# EasyEDA Pro project ProPrj_omb-2024-nano_2026-02-09.epro, schematic Schematic1_5

## Sheets
1 P1: Board Name: v5-artemis-ble; Create Date: 2025-02-28; Page Name: P1; Project Name: omb-2024-nano; Schematic Name: Schematic1_5; Update Date: 2025-03-06; Company: EasyEDA.com; Drawn: gauteh, rogers; Page Size: A4; Part Number: JLCPCB-002; Reviewed: EasyEDA; Version: V1.4
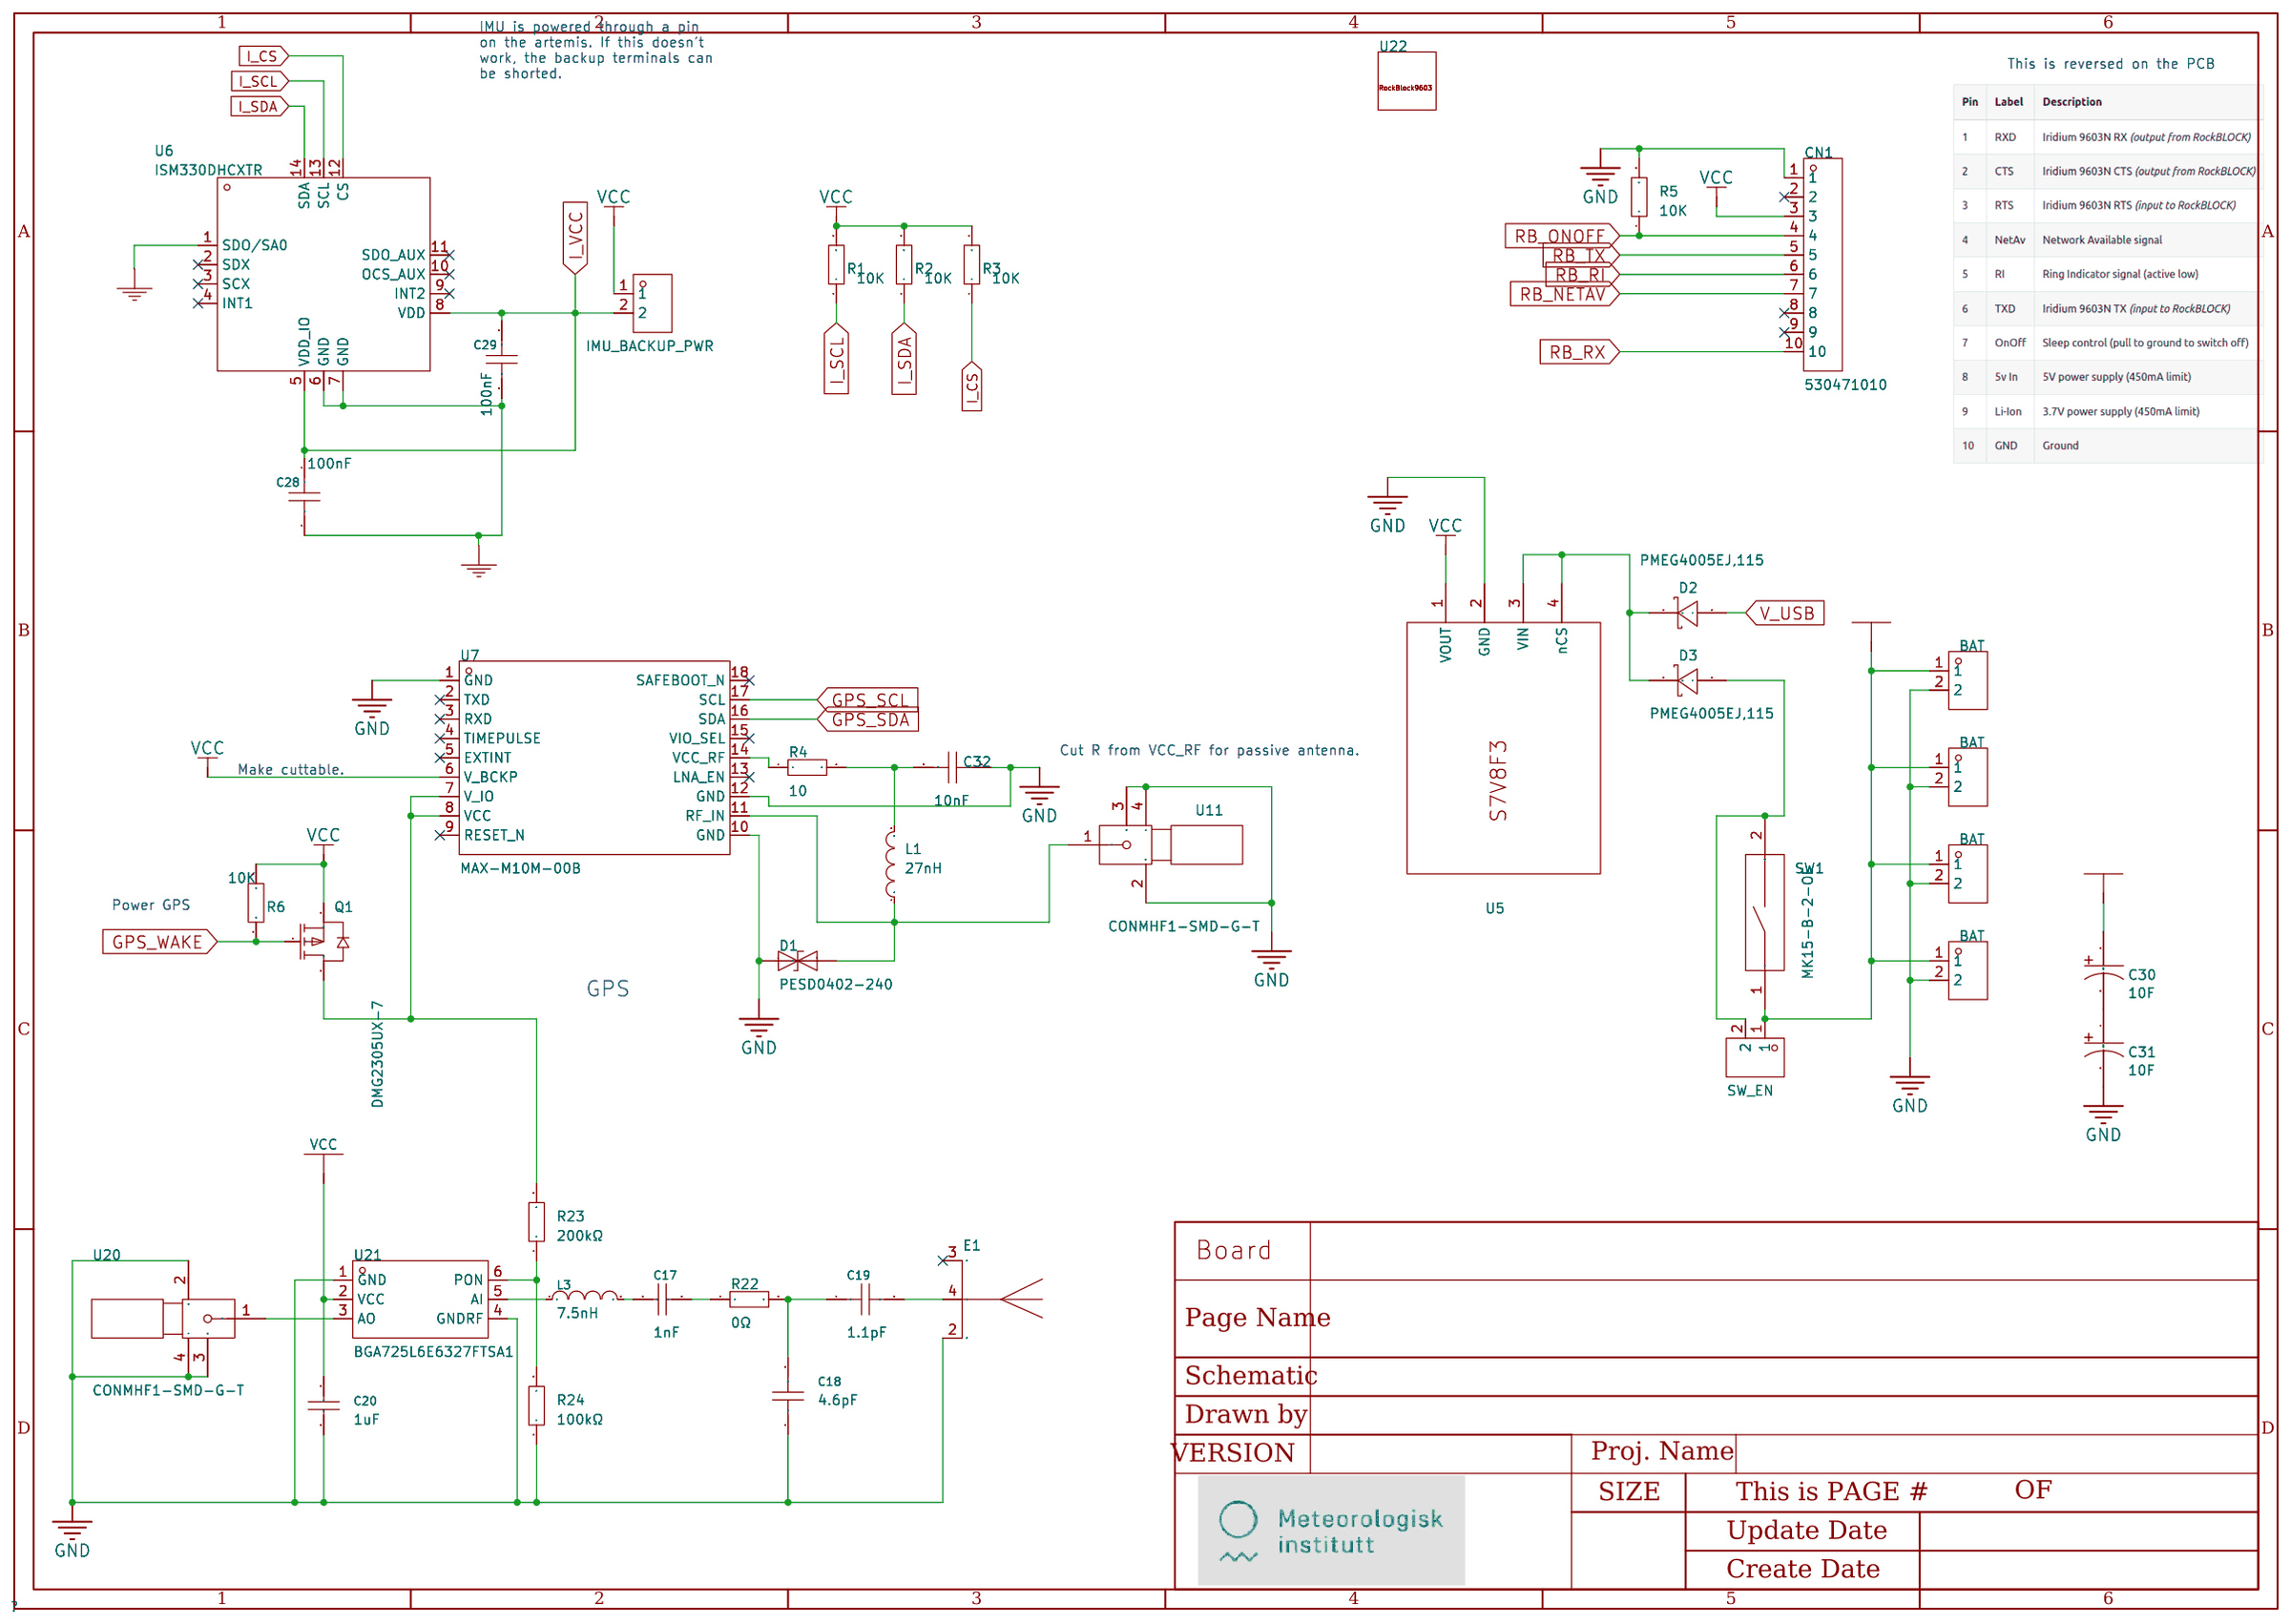
[diagram p5: P1]
2 P2: Page Name: P2; Drawn: rogers; Version: v1.4
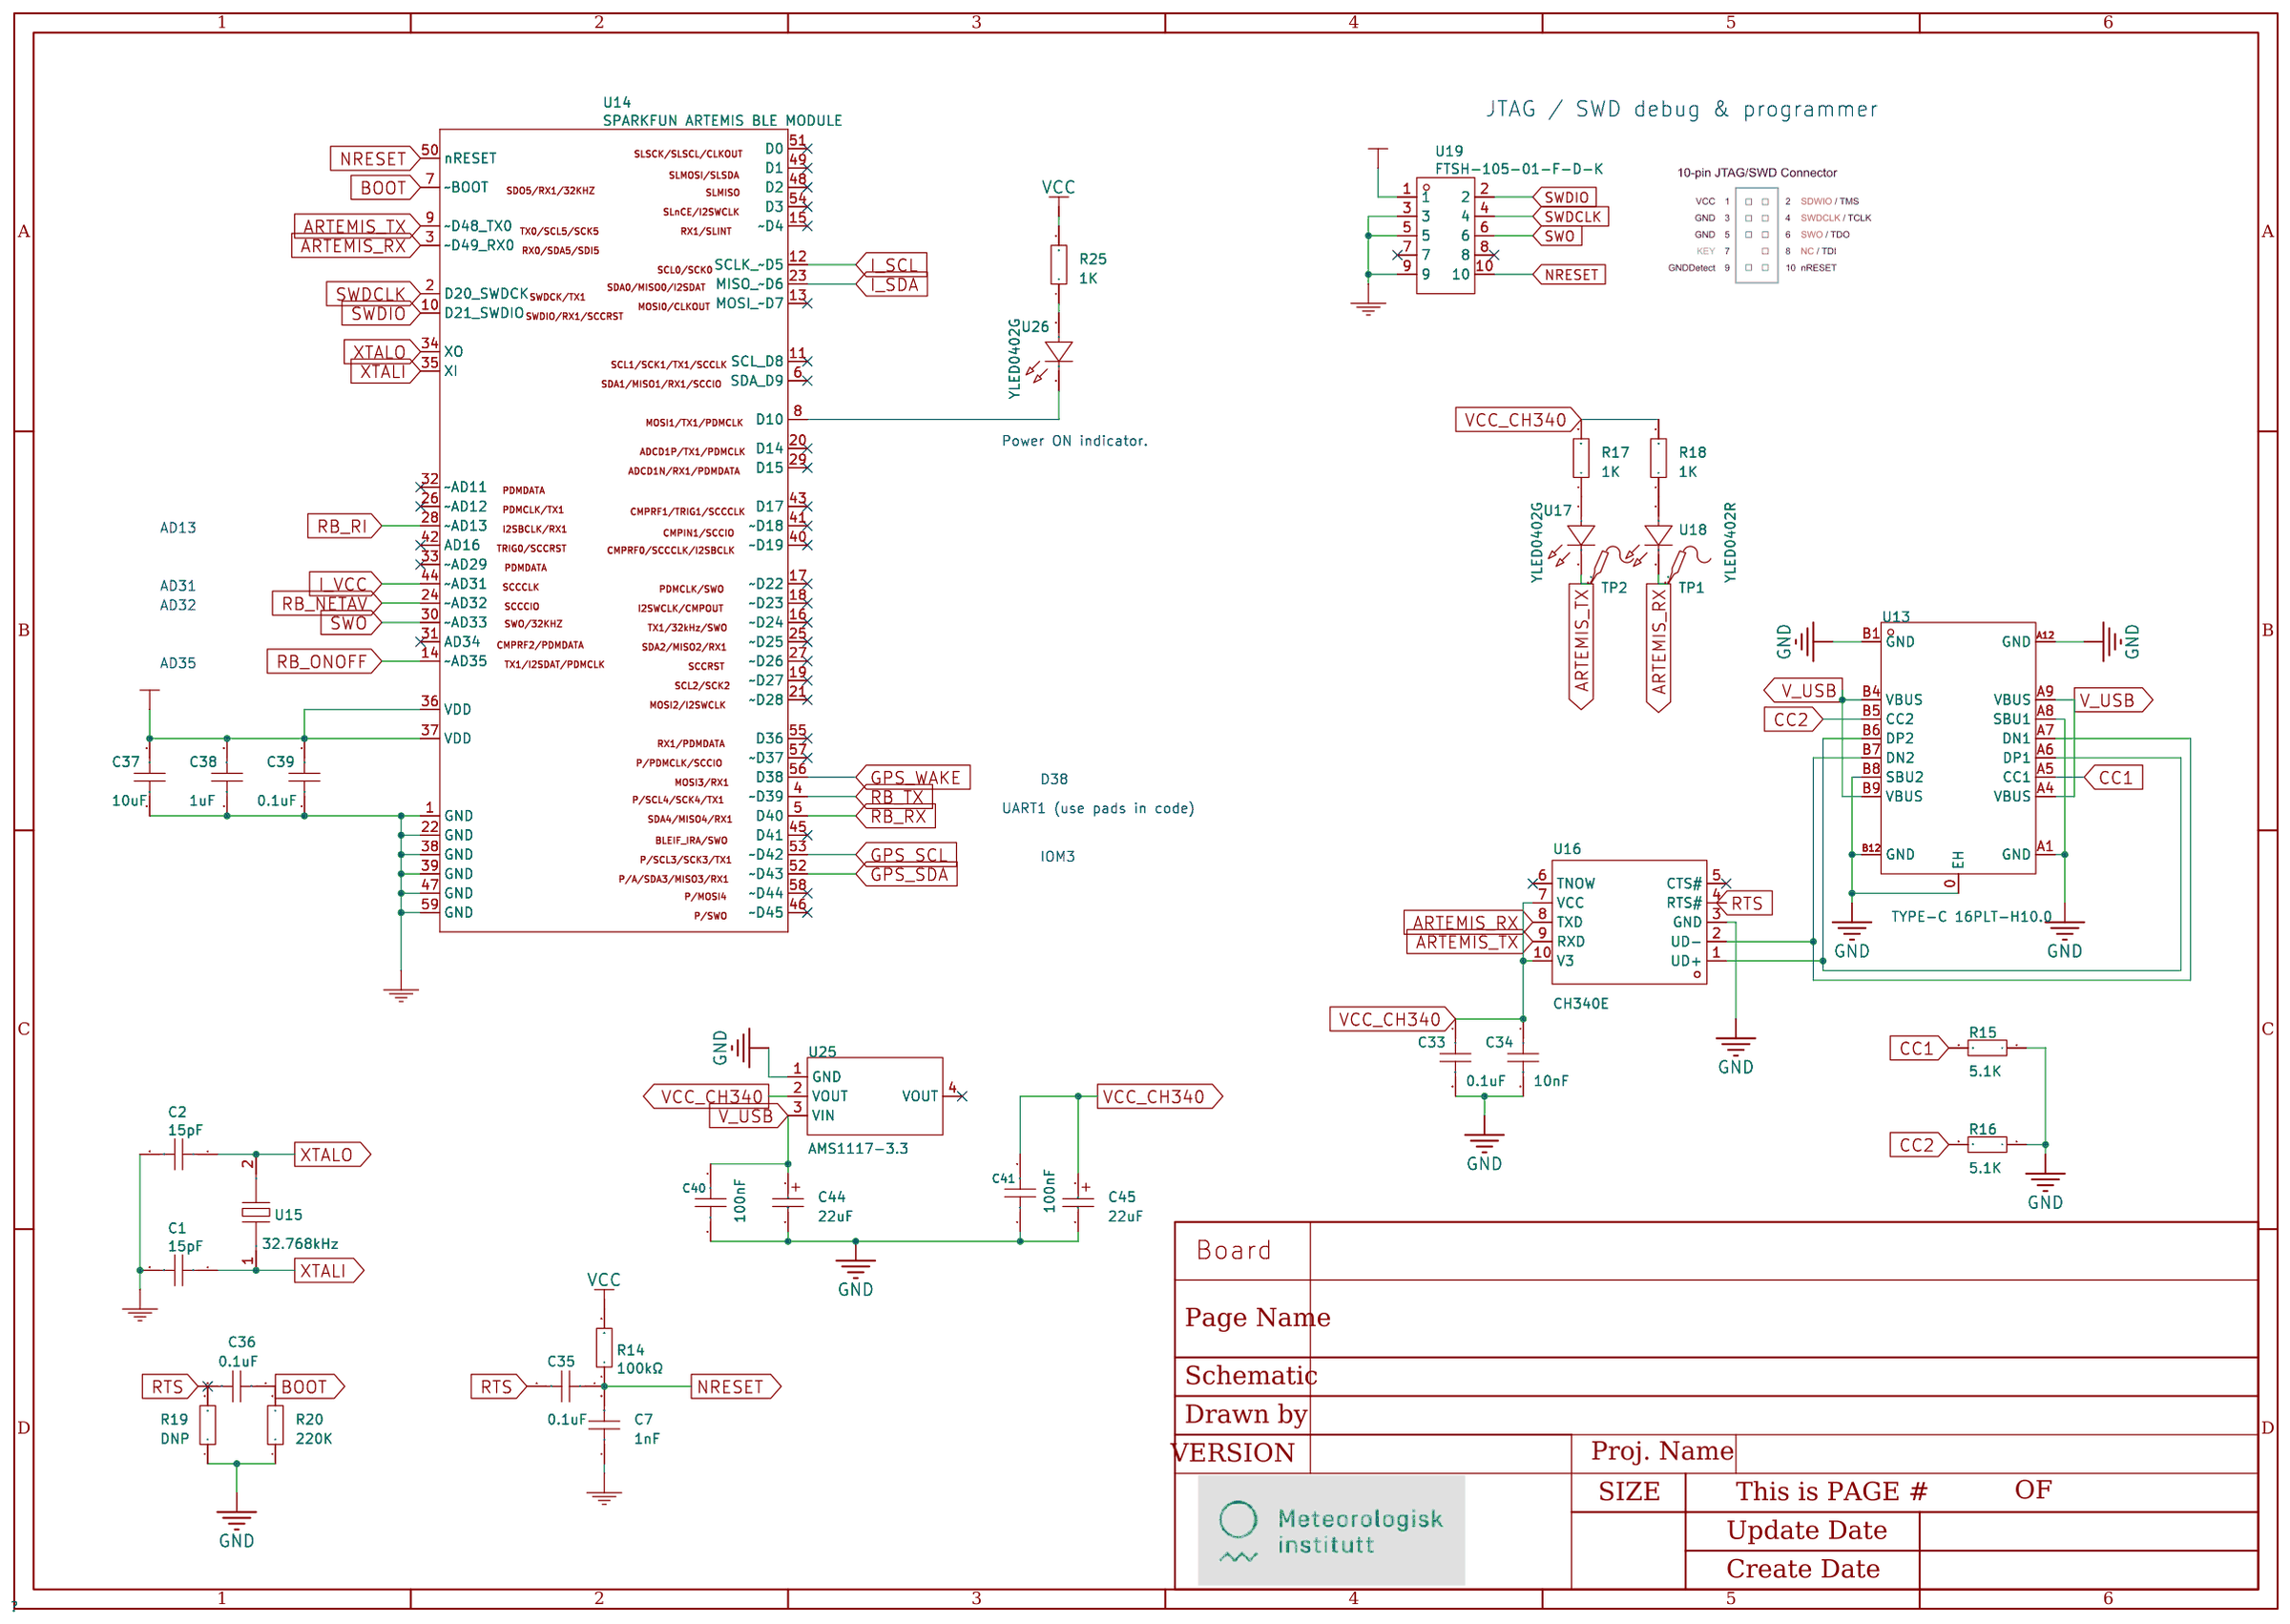
[diagram p6: P2]

## Parts
sheet P1
BAT1  BAT  [HDR-TH_2P-P2.54-V-M-1]  (no BOM)
BAT2  BAT  [HDR-TH_2P-P2.54-V-M-1]  (no BOM)
BAT3  BAT  [HDR-TH_2P-P2.54-V-M-1]  (no BOM)
BAT4  BAT  [HDR-TH_2P-P2.54-V-M-1]  (no BOM)
C17  1nF  [C0402]
C18  4.6pF  [C0402]
C19  1.1pF  [C0402]
C20  1uF  [C0402]
C28  100nF  [C0402]
C29  100nF  [C0402]
C30  10F  [CP_12.5X20MM]  (no BOM)
C31  10F  [CP_12.5X20MM]  (no BOM)
C32  10nF  [C0603]
CN1  530471010  [CONN-TH_530471010]
D1  PESD0402-240  [D0402-BI]
D2  PMEG4005EJ,115  [SOD-323_L1.7-W1.3-LS2.5-RD]
D3  PMEG4005EJ,115  [SOD-323_L1.7-W1.3-LS2.5-RD]
E1  NN03-320  [NN03-320]
IMUBACKUPPWR1  IMU_BACKUP_PWR  [HDR-TH_2P-P2.54-V-M-1]  (no BOM)
L1  27nH  [L0402]
L3  7.5nH  [IND-SMD_L1.0-W0.6]
Q1  DMG2305UX-7  [SOT-23-3_L2.9-W1.3-P1.90-LS2.4-BR]
R1  10K  [R0603]
R2  10K  [R0603]
R3  10K  [R0603]
R4  10  [R0603]
R5  10K  [R0603]
R6  10K  [R0603]
R22  0Ω  [R0603]
R23  200kΩ  [R0402]
R24  100kΩ  [R0402]
SW1  MK15-B-2-OE  [SW-SMD_L16.0-W2.5-P19.5_MK15-B-2-OE]
SWEN1  SW_EN  [HDR-TH_2P-P2.54-V-M-1]  (no BOM)
U5  -  [HDR-F-2.54_1X4]  (no BOM)
U6  ISM330DHCXTR  [LGA-14_L3.0-W2.5-P0.50-BR]
U7  MAX-M10M-00B  [COMM-SMD_L10.1-W9.7-P1.10_GT-1110F2-AGGB]
U11  CONMHF1-SMD-G-T  [RF-SMD_CONMHF1-SMD-G-T]
U20  CONMHF1-SMD-G-T  [RF-SMD_CONMHF1-SMD-G-T]
U21  BGA725L6E6327FTSA1  [TSLP-6_L1.1-W0.7-P0.40-BR]
U22  -  [CONN-TH_530471010]  (no BOM)
sheet P2
C1  15pF  [C0402]
C2  15pF  [C0402]
C7  1nF  [C0402]
C33  0.1uF  [C0603]
C34  10nF  [C0603]
C35  0.1uF  [C0603]
C36  0.1uF  [C0603]
C37  10uF  [C0603]
C38  1uF  [C0603]
C39  0.1uF  [C0603]
C40  100nF  [C0402]
C41  100nF  [C0402]
C44  22uF  [C0805]
C45  22uF  [C0805]
R14  100kΩ  [R0402]
R15  5.1K  [R0603]
R16  5.1K  [R0603]
R17  1K  [R0402]
R18  1K  [R0402]
R19  DNP  [R0603]  (no BOM)
R20  220K  [R0603]
R25  1K  [R0402]
TP1  -  [Test-Point-0.5mm]  (no BOM)
TP2  -  [Test-Point-0.5mm]  (no BOM)
U13  TYPE-C 16PLT-H10.0  [TYPE-C-SMD_USB4120-03-C]
U14  SPARKFUN ARTEMIS BLE MODULE  [ARTEMIS_BLE]
U15  32.768kHz  [CRYSTAL-SMD_L2.0-W1.2]
U16  CH340E  [MSOP-10_L3.0-W3.0-P0.50-LS5.0-BL]
U17  YLED0402G  [LED0402-R-RD]
U18  YLED0402R  [LED0402-R-RD]
U19  FTSH-105-01-F-D-K  [CONN-TH_10P-P1.27_FTSH-105-01-F-D-K]  (no BOM)
U25  AMS1117-3.3  [SOT-223-3_L6.5-W3.4-P2.30-LS7.0-BR]
U26  YLED0402G  [LED0402-R-RD]

## Library data of the parts
BAT1-BAT4 IMUBACKUPPWR1 SWEN1 = 22284020: Pin Structure:1x2P Pitch:2.54mm Row Spacing:- Circluar Pins/Square Pins:Square Pins Mounting Type:Straight Number of Rows:Plugin Number of Pins:2P Current Rating (Max):- Voltage Rating (Max):- Length of Mating Pin:- Insulation Height:- Contact Material: C; LCSC Part Name: 间距:2.54mm 1x2P 直插 方针; Supplier Part: C234182; Manufacturer: MOLEX; Supplier Footprint: 插件,P=2.54mm; JLCPCB Part Class: Extended Part; Datasheet: https://atta.szlcsc.com/upload/public/pdf/source/20180801/C234182_F77B1C2A9EF8AC9B34CEB7670B45930E.pdf; Supplier: LCSC; Pin Structure: 1x2P; Pitch: 2.54mm; Circluar Pins/Square Pins: Square Pins; Mounting Type: Straight; Number of Rows: Plugin; Number of Pins: 2P; Color: Black
C7 C17 = CC0402KRX7R9BB102: Capacitance: Tolerance:±10% Tolerance:±10% Voltage Rated: Temperature Coefficient:; LCSC Part Name: 1nF ±10% 50V; Supplier Part: C106205; Manufacturer: YAGEO(国巨); Supplier Footprint: 0402; JLCPCB Part Class: Extended Part; Datasheet: https://atta.szlcsc.com/upload/public/pdf/source/20181008/C309510_22F155564471FAF6A489F7D68F34234E.pdf; Supplier: LCSC; Tolerance: ±10%
C18 = CBR04C469B5GAC: Capacitance: Voltage Rated: Temperature Coefficient:; LCSC Part Name: 4.6pF 50V; Supplier Part: C600260; Manufacturer: KEMET(基美); Supplier Footprint: 0402; JLCPCB Part Class: Extended Part; Datasheet: https://atta.szlcsc.com/upload/public/pdf/source/20200414/C513330_C9B0C839AB42DCB65FF29F8BB4398565.pdf; Supplier: LCSC
C19 = GJM1555C1H1R1WB01D: Capacitance: Voltage Rated: Temperature Coefficient:; LCSC Part Name: 1.1pF 50V; Supplier Part: C88879; Manufacturer: muRata(村田); Supplier Footprint: 0402; JLCPCB Part Class: Extended Part; Datasheet: https://atta.szlcsc.com/upload/public/pdf/source/20190904/C426118_85E81C7C1F21FC87C5FB6D536E0847B4.pdf; Supplier: LCSC
C20 = CL05A105KO5NNNC: Capacitance: Tolerance:±10% Tolerance:±10% Voltage Rated: Temperature Coefficient:; LCSC Part Name: 1uF ±10% 16V; Supplier Part: C29266; Manufacturer: SAMSUNG(三星); Supplier Footprint: 0402; JLCPCB Part Class: Extended Part; Datasheet: https://atta.szlcsc.com/upload/public/pdf/source/20160218/1457707763339.pdf; Supplier: LCSC; Tolerance: ±10%
C28 C29 C40 C41 = CC0402KRX7R7BB104: Capacitance: Tolerance:±10% Tolerance:±10% Voltage Rated: Temperature Coefficient:; LCSC Part Name: 100nF ±10% 16V; Supplier Part: C60474; Manufacturer: YAGEO(国巨); Supplier Footprint: 0402; JLCPCB Part Class: Extended Part; Datasheet: https://atta.szlcsc.com/upload/public/pdf/source/20211223/9278FD768280B81DDBEF48FA36411A03.pdf; Supplier: LCSC; Tolerance: ±10%
C30 C31 = 10F: Supplier Part: 581-SCCT20B106PRB; Supplier: Mouser; Manufacturer: AVX; Manufacturer Part: SCCT20B106PRB; Link: https://www.mouser.com/datasheet/2/40/AVX-SCC-1018831.pdf
C32-C39 = CAP_0603: Supplier Footprint: 0603
CN1 = 530471010: Pins Structure:1x10P Pitch:1.25mm Mounting Style:Direct Insert Reference Series:PicoBlade(MX 1.25) Number of Pins:10P Number of Rows:1 Number of PINs Per Row:10 Row Spacing:- Current Rating (Max):1A Contact Material:Phosphor Bronze Contact Plating:Tin Ope; LCSC Part Name: 1x10P 间距:1.25mm 直插 系列:PicoBlade(MX 1.25); Supplier Part: C505021; Manufacturer: MOLEX; Supplier Footprint: 插件,P=1.25mm; JLCPCB Part Class: Extended Part; Datasheet: https://www.molex.com/content/dam/molex/molex-dot-com/products/automated/en-us/salesdrawingpdf/530/53047/530471010_sd.pdf?inline; Supplier: LCSC; Pins Structure: 1x10P; Pitch: 1.25mm; Mounting Style: Direct Insert; Reference Series: PicoBlade(MX 1.25); Number of Pins: 10P; Number of Rows: 1; Number of PINs Per Row: 10; Current Rating (Max): 1A; Contact Material: Phosphor Bronze; Contact Plating: Tin; Operating Temperature Range: -40℃~+85℃; Rated Voltage (Max): 125V; Plastic Material: PA; Flame Retardant Rating: UL94V-0; Colour: White; Z-Height of the Board: 4.2mm; X-Length of Bottom Edge on Board (Spacing Line): 14.25mm; Y-Width of Bottom Edge on Board: 3.2mm
D1 = PESD0402-240_C1975527: polarity:Bi-Directional Reverse Stand-Off Voltage (Vrwm):24V Maximum Clamping Voltage:40V@Typ Peak Pulse Current (Ipp)@10/1000us:- Peak Pulse Power Dissipation (Ppp)@10/1000us:- Breakdown Voltage:- Type:TVS; LCSC Part Name: TVS 24V截止; Supplier Part: C1975527; Manufacturer: Littelfuse(美国力特); Supplier Footprint: 0402; JLCPCB Part Class: Extended Part; Datasheet: https://atta.szlcsc.com/upload/public/pdf/source/20210701/51AB13F941E3C29FA17D39B567B0F81A.pdf; Supplier: LCSC; polarity: Bi-Directional; Reverse Stand-Off Voltage (Vrwm): 24V; Maximum Clamping Voltage: 40V@Typ; Type: TVS
D2 D3 = PMEG4005EJ,115: Forward Voltage (Vf@If):470mV@500mA Reverse Voltage (Vr):40V Rectified Current:500mA Reverse Leakage Current (Ir):100uA@40V; LCSC Part Name: 电压:40V 电流:500mA; Supplier Part: C426868; Manufacturer: Nexperia(安世); Supplier Footprint: SOD-323F; JLCPCB Part Class: Extended Part; Datasheet: https://atta.szlcsc.com/upload/public/pdf/source/20240724/F461DBC170D94A235AE4AF730E3F5E89.pdf; Supplier: LCSC; Forward Voltage (Vf@If): 470mV@500mA; Reverse Voltage (Vr): 40V; Rectified Current: 500mA; Reverse Leakage Current (Ir): 100uA@40V
E1 = NN03-320: Manufacturer: Fractus Antennas S.L.; Manufacturer Part: C9900018569
L1 = LQG15HZ27NH02D: Inductance: Tolerance:±3% Tolerance:±3% Rated Current: Saturation Current (Isat):- DC Resistance (DCR): Q @ Freq:8@100MHz Frequency - Self Resonant: Ratings:AEC-Q200 Type:叠层电感; LCSC Part Name: 27nH ±3%; Supplier Part: C237452; Manufacturer: muRata(村田); Supplier Footprint: 0402; JLCPCB Part Class: Extended Part; Datasheet: https://atta.szlcsc.com/upload/public/pdf/source/20190726/C408154_059E1F516C2F33FE9237CE464B368FAF.pdf; Supplier: LCSC; Tolerance: ±3%; Q @ Freq: 8@100MHz; Ratings: AEC-Q200; Type: 叠层电感
L3 = LQW15AN7N5H00D: Inductance:7.5nH Tolerance:±3% Tolerance:±3% Rated Current: Saturation Current (Isat):- DC Resistance (DCR): Ratings:-; LCSC Part Name: 7.5nH ±3%; Supplier Part: C397303; Manufacturer: muRata(村田); Supplier Footprint: 0402; JLCPCB Part Class: Extended Part; Datasheet: https://atta.szlcsc.com/upload/public/pdf/source/20191016/C437364_463D6516B3BAE72B1DA0754F3D9B8308.pdf; Supplier: LCSC; Tolerance: ±3%
Q1 = DMG2305UX-7: Type:1个PChannel Drain Source Voltage (Vdss): Continuous Drain Current (Id): Power Dissipation (Pd): Drain Source On Resistance (RDS(on)@Vgs,Id):52mΩ@4.5V,4.2A Gate Threshold Voltage (Vgs(th)@Id):900mV@250uA Total Gate Charge (Qg@Vgs):10.2nC@4.5V Input Cap; LCSC Part Name: 1个P沟道 耐压:20V 电流:4.2A; Supplier Part: C150470; Manufacturer: DIODES(美台); Supplier Footprint: SOT-23; JLCPCB Part Class: Extended Part; Datasheet: https://atta.szlcsc.com/upload/public/pdf/source/20171221/C150470_15138312285201195465.pdf; Supplier: LCSC; Type: 1个PChannel; Drain Source On Resistance (RDS(on)@Vgs,Id): 52mΩ@4.5V,4.2A; Gate Threshold Voltage (Vgs(th)@Id): 900mV@250uA; Total Gate Charge (Qg@Vgs): 10.2nC@4.5V; Input Capacitance (Ciss@Vds): 808pF@15V; Operating Temperature: -55℃~+150℃@(Tj)
R1-R6 R15-R20 R25 = Res_0603: Supplier Footprint: 0603
R22 = RC0603JR-070RL: Type:Thick Film Resistors Resistance: Tolerance:±5% Tolerance:±5% Power(Watts): Overload Voltage (Max): Operating Temperature Range:-55℃~+155℃ Operating Temperature Range:-55℃~+155℃; LCSC Part Name: 厚膜电阻 0Ω ±5% 100mW; Supplier Part: C95177; Manufacturer: YAGEO(国巨); Supplier Footprint: 0603; JLCPCB Part Class: Extended Part; Datasheet: https://atta.szlcsc.com/upload/public/pdf/source/20170818/C126805_1503051298841895366.pdf; Supplier: LCSC; Type: Thick Film Resistors; Tolerance: ±5%; Operating Temperature Range: -55℃~+155℃
R23 = RC0402FR-07200KL: Type:Thick Film Resistors Resistance: Tolerance:±1% Tolerance:±1% Power(Watts): Overload Voltage (Max): Temperature Coefficient:±100ppm/℃ Temperature Coefficient:±100ppm/℃ Operating Temperature Range:-55℃~+155℃ Operating Temperature Range:-55℃~+155℃; LCSC Part Name: 厚膜电阻 200kΩ ±1% 62.5mW; Supplier Part: C114763; Manufacturer: YAGEO(国巨); Supplier Footprint: 0402; JLCPCB Part Class: Extended Part; Datasheet: https://atta.szlcsc.com/upload/public/pdf/source/20180821/C275644_0D56F95EFF785E7D9A1FEF436B37DA78.pdf; Supplier: LCSC; Type: Thick Film Resistors; Tolerance: ±1%; Temperature Coefficient: ±100ppm/℃; Operating Temperature Range: -55℃~+155℃
R14 R24 = RC0402FR-07100KL: Type:Thick Film Resistors Resistance: Tolerance:±1% Tolerance:±1% Power(Watts): Overload Voltage (Max): Temperature Coefficient:±100ppm/℃ Temperature Coefficient:±100ppm/℃ Operating Temperature Range:-55℃~+155℃ Operating Temperature Range:-55℃~+155℃; LCSC Part Name: 厚膜电阻 100kΩ ±1% 62.5mW; Supplier Part: C60491; Manufacturer: YAGEO(国巨); Supplier Footprint: 0402; JLCPCB Part Class: Extended Part; Datasheet: https://atta.szlcsc.com/upload/public/pdf/source/20180927/C295883_E8D83085EA81BD7DE0B2B681138C15EE.pdf; Supplier: LCSC; Type: Thick Film Resistors; Tolerance: ±1%; Temperature Coefficient: ±100ppm/℃; Operating Temperature Range: -55℃~+155℃
SW1 = MK15-B-2-OE: supply voltage:- supply voltage:- Operation Points:- Operation Points:- Operating Temperature:-40℃~+130℃ Operating Temperature:-40℃~+130℃; Supplier Part: C3716286; Manufacturer: STANDEXMEDER(斯丹麦德); JLCPCB Part Class: Extended Part; Datasheet: https://atta.szlcsc.com/upload/public/pdf/source/20240124/9814EFDBFAAD46A2A6CA9C6BAB54863C.pdf; Supplier: LCSC; Operating Temperature: -40℃~+130℃
U5 = S7V8F3
U6 = ISM330DHCXTR: Supplier: LCSC; Supplier Part: C2655101; Manufacturer: ST(意法半导体); JLCPCB Part Class: Extended Part
U7 = MAX-M10M-00B: GNSS Type:Galileo；GLONASS；GNSS；BeiDou；GPS Interface Type:UART；I2C Operating Supply Voltage:1.8V~5.5V Operating Supply Voltage:1.8V~5.5V Sensitivity:-164dBm Sensitivity:-164dBm Operating Temperature:-40℃~+85℃ Operating Temperature:-40℃~+85℃; Supplier Part: C6293820; Manufacturer: U-BLOX; Supplier Footprint: SMD-18P; JLCPCB Part Class: Extended Part; Datasheet: https://atta.szlcsc.com/upload/public/pdf/source/20240419/967224AC3920E85269F3E8F14711A56A.pdf; Supplier: LCSC; GNSS Type: Galileo；GLONASS；GNSS；BeiDou；GPS; Interface Type: UART；I2C; Operating Supply Voltage: 1.8V~5.5V; Sensitivity: -164dBm; Operating Temperature: -40℃~+85℃
U11 U20 = CONMHF1-SMD-G-T: Connector Type:板端 Number of Ports:1 Frequency-Max:6GHz RF Series:IPEX Impedance:50Ω Contact Material:Copper Alloy Contact Plating:Gold Operating Temperature Range:-65℃~+165℃ Operating Temperature Range:-65℃~+165℃; LCSC Part Name: IPEX; Supplier Part: C3174614; Manufacturer: Linx; JLCPCB Part Class: Extended Part; Supplier: LCSC; Connector Type: 板端; Number of Ports: 1; Frequency-Max: 6GHz; RF Series: IPEX; Impedance: 50Ω; Contact Material: Copper Alloy; Contact Plating: Gold; Operating Temperature Range: -65℃~+165℃
U21 = BGA725L6E6327FTSA1: Applications:GPS,GNSS Frequency Range:1.55GHz~1.615GHz Frequency Range:1.55GHz~1.615GHz Gain:20dB Noise Figure:0.65dB Supply Voltage:1.5V~3.6V Supply Voltage:1.5V~3.6V Supply Current:3.6mA; Supplier Part: C2649466; Manufacturer: Infineon(英飞凌); Supplier Footprint: DFN-6(0.7x1.1); JLCPCB Part Class: Extended Part; Datasheet: https://atta.szlcsc.com/upload/public/pdf/source/20211206/2E6B0317A65C39FEDF5554E21B6728AE.pdf; Supplier: LCSC; Applications: GPS,GNSS; Frequency Range: 1.55GHz~1.615GHz; Gain: 20dB; Noise Figure: 0.65dB; Supply Voltage: 1.5V~3.6V; Supply Current: 3.6mA
U22 = ROCKBLOCK9603
C1 C2 = 15pF: Supplier: LCSC; Supplier Part: C325460; Manufacturer: YAGEO(国巨); Manufacturer Part: CC0402GRNPO9BN150; JLCPCB Part Class: Extended Part
C44 C45 = CL21A226MAYNNNE: Capacitance: Tolerance:±20% Tolerance:±20% Voltage Rated: Temperature Coefficient:; LCSC Part Name: 22uF ±20% 25V; Supplier Part: C602037; Manufacturer: SAMSUNG(三星); Supplier Footprint: 0805; JLCPCB Part Class: Extended Part; Datasheet: https://atta.szlcsc.com/upload/public/pdf/source/20200609/C602037_1A0D619693E608A1BF6E80154254E2DB.pdf; Supplier: LCSC; Tolerance: ±20%
TP1 TP2 = Test-Point: Test Point 测试点
U13 = TYPE-C 16PLT-H10.0: Connector Type:Type-C Standard:- Gender:Female Number of Ports:1 Number of Contacts:16P Mounting Style:Brick nogging Current Rating - Power (Max):5A Contact Material:- Contact Plating:- Operating Temperature Range:-40℃~+85℃ Operating Temperature Range:-40; LCSC Part Name: Type-C 母 立贴; Supplier Part: C3151749; Manufacturer: SHOU HAN(首韩); Supplier Footprint: SMD; JLCPCB Part Class: Extended Part; Datasheet: https://atta.szlcsc.com/upload/public/pdf/source/20220627/29253729C3C7BA78ED37A3D91B55CE65.pdf; Supplier: LCSC; Connector Type: Type-C; Gender: Female; Number of Ports: 1; Number of Contacts: 16P; Mounting Style: Brick nogging; Current Rating - Power (Max): 5A; Operating Temperature Range: -40℃~+85℃
U14 = SPARKFUN ARTEMIS BLE MODULE: Manufacturer: SPARKFUN; Manufacturer Part: WRL-15484; Supplier: Sparkfun; Supplier Part: WRL-15484; link: https://www.sparkfun.com/products/15484
U15 = 32.768kHz: Supplier: LCSC; Supplier Part: C5341285; Manufacturer: Micro Crystal(瑞士微晶); Manufacturer Part: CM8V-T1A-32.768KHZ-12.5PF-20PPM-TA-QC; JLCPCB Part Class: Extended Part
U16 = CH340E: Applications Function:Transceiver Protocol: Supply Voltage:3.3V；5V Supply Voltage:3.3V；5V Data Rate:2Mbps; LCSC Part Name: USB转串口芯片 CH340; Supplier Part: C99652; Manufacturer: WCH(南京沁恒); Supplier Footprint: MSOP-10; JLCPCB Part Class: Extended Part; Datasheet: https://atta.szlcsc.com/upload/public/pdf/source/20230530/6E401E9554E9F5311886CC8B3F89B62E.pdf; Supplier: LCSC; Applications Function: Transceiver; Supply Voltage: 3.3V；5V; Data Rate: 2Mbps
U17 U26 = YLED0402G: LCSC Part Name: 发光管; Supplier Part: C20608784; Manufacturer: YONGYUTAI(永裕泰); Supplier Footprint: 0402; JLCPCB Part Class: Extended Part; Datasheet: https://atta.szlcsc.com/upload/public/pdf/source/20240119/2792316D86947EC95655E09EC4742546.pdf; Supplier: LCSC
U18 = YLED0402R: LCSC Part Name: 发光管; Supplier Part: C21260817; Manufacturer: YONGYUTAI(永裕泰); Supplier Footprint: 0402; JLCPCB Part Class: Extended Part; Datasheet: https://atta.szlcsc.com/upload/public/pdf/source/20240304/F5B78DC4846D6E27B24F174B920B2C01.pdf; Supplier: LCSC
U19 = FTSH-105-01-F-D-K: Supplier: LCSC; Supplier Part: C9900011230; Manufacturer: null; JLCPCB Part Class: Extended Part
U25 = AMS1117-3.3_C6186: Output Type:Fixed Voltage - Supply:- Output Voltage:3.3V Output Voltage:3.3V Output Current:1A Power Supply Rejection Ratio (PSRR):72dB@(120Hz) Voltage Dropout:1.3V@(800mA) standby current:- Noise:- Features:Overcurrent Protection(OCP)；热关断(TSD) Operating; LCSC Part Name: 输出3.3V 1A; Supplier Part: C6186; Manufacturer: AMS; Supplier Footprint: SOT-223; JLCPCB Part Class: Basic Part; Datasheet: https://atta.szlcsc.com/upload/public/pdf/source/20180727/C6186_7A095716F0823C02F1997A905E26C086.pdf; Supplier: LCSC; Output Type: Fixed; Output Voltage: 3.3V; Output Current: 1A; Power Supply Rejection Ratio (PSRR): 72dB@(120Hz); Voltage Dropout: 1.3V@(800mA); Features: Overcurrent Protection(OCP)；热关断(TSD); Output Configuration: Positive electrode; Number of Outputs: 1

## Nets
GND: BAT1.2 BAT2.2 BAT3.2 BAT4.2 C1.2 C2.2 C7.1 C18.1 C20.1 C28.2 C29.2 C31.2 C32.1 C33.2 C34.2 C37.1 C38.1 C39.1 C40.2 C41.2 C44.2 C45.2 CN1.1 D1.1(K) E1.2 R5.2 R15.1 R16.1 R19.1 R20.1 R24.1 U5.2(GND) U6.1(SDO/SA0) U6.6(GND) U6.7(GND) U7.1(GND) U7.10(GND) U7.12(GND) U11.2 U11.3 U11.4 U13.0(EH) U13.A1(GND) U13.A8(SBU1) U13.A12(GND) U13.B1(GND) U13.B8(SBU2) U13.B12(GND) U14.1(GND) U14.22(GND) U14.38(GND) U14.39(GND) U14.47(GND) U14.59(GND) U16.3(GND) U19.3 U19.5 U19.9 U20.2 U20.3 U20.4 U21.1(GND) U21.4(GNDRF) U25.1(GND)
VBAT+: BAT1.1 BAT2.1 BAT3.1 BAT4.1 C30.1 SW1.1 SWEN1.1
VCC: C20.2 C37.2 C38.2 C39.2 CN1.3 IMUBACKUPPWR1.1 Q1.2(S) R1.2 R2.2 R3.2 R6.1 R14.2 R25.2 U5.1(VOUT) U7.6(V_BCKP) U14.36(VDD) U14.37(VDD) U19.1 U21.2(VCC)
VCC_CH340: C33.1 C34.1 C41.1 C45.1 R17.2 R18.2 U16.7(VCC) U16.10(V3) U25.2(VOUT)
ARTEMIS_RX: TP1.1 U14.3(~D49 RX0) U16.8(TXD) U18.2(K)
ARTEMIS_TX: TP2.1 U14.9(~D48 TX0) U16.9(RXD) U17.2(K)
BOOT: C36.1 R20.2 U14.7(~BOOT)
CC1: R15.2 U13.A5(CC1)
CC2: R16.2 U13.B5(CC2)
GPS_SCL: U7.17(SCL) U14.53(~D42)
GPS_SDA: U7.16(SDA) U14.52(~D43)
GPS_WAKE: Q1.1(G) R6.2 U14.56(D38)
I_CS: R3.1 U6.12(CS)
I_SCL: R1.1 U6.13(SCL) U14.12(SCLK ~D5)
I_SDA: R2.1 U6.14(SDA) U14.23(MISO ~D6)
I_VCC: C28.1 C29.1 IMUBACKUPPWR1.2 U6.5(VDD_IO) U6.8(VDD) U14.44(~AD31)
NRESET: C7.2 C35.1 R14.1 U14.50(nRESET) U19.10
RB_NETAV: CN1.7 U14.24(~AD32)
RB_ONOFF: CN1.4 R5.1 U14.14(~AD35)
RB_RI: CN1.6 U14.28(~AD13)
RB_RX: CN1.10 U14.5(D40)
RB_TX: CN1.5 U14.4(~D39)
RTS: C35.2 C36.2 U16.4(RTS#)
SWDCLK: U14.2(D20 SWDCK) U19.4
SWDIO: U14.10(D21 SWDIO) U19.2
SWO: U14.30(~AD33) U19.6
V_USB: C40.1 C44.1 D2.2(A) U13.A4(VBUS) U13.A9(VBUS) U13.B4(VBUS) U13.B9(VBUS) U25.3(VIN)
XTALI: C1.1 U14.35(XI) U15.1
XTALO: C2.1 U14.34(XO) U15.2(GND)
$1N2984: C30.2 C31.1
$1N5235: R4.1 U7.14(VCC_RF)
$1N5486: D1.2(A) L1.1 U7.11(RF_IN) U11.1
$1N5497: C32.2 L1.2 R4.2
$1N22081: U20.1 U21.3(AO)
$1N22083: C19.2 E1.4
$1N22085: L3.1 U21.5(AI)
$1N22086: C17.1 L3.2
$1N22087: C17.2 R22.1
$1N22088: C18.2 C19.1 R22.2
$1N22089: R23.1 R24.2 U21.6(PON)
$1N29349: D3.2(A) SW1.2 SWEN1.2
$1N29353: D2.1(C) D3.1(C) U5.3(VIN) U5.4(nCS)
$1N37399: Q1.3(D) R23.2 U7.7(V_IO) U7.8(VCC)
$2N2050: U13.A6(DP1) U13.B6(DP2) U16.1(UD+)
$2N2057: U13.A7(DN1) U13.B7(DN2) U16.2(UD-)
$2N3400: R17.1 U17.1(A)
$2N3462: R18.1 U18.1(A)
$2N12878: U14.8(D10) U26.2(K)
$2N12883: R25.1 U26.1(A)

Not connected (* = marked no-connect by the designer): CN1 2* 8* 9*; E1 3*; R19 2*; U6 2(SDX)* 3(SCX)* 4(INT1)* 9(INT2)* 10(OCS_AUX)* 11(SDO_AUX)*; U7 2(TXD)* 3(RXD)* 4(TIMEPULSE)* 5(EXTINT)* 9(RESET_N)* 13(LNA_EN)* 15(VIO_SEL)* 18(SAFEBOOT_N)*; U14 6(SDA D9)* 11(SCL D8)* 13(MOSI ~D7)* 15(~D4)* 16(~D24)* 17(~D22)* 18(~D23)* 19(~D27)* 20(D14)* 21(~D28)* 25(~D25)* 26(~AD12)* 27(~D26)* 29(D15)* 31(AD34)* 32(~AD11)* 33(~AD29)* 40(~D19)* 41(~D18)* 42(AD16)* 43(D17)* 45(D41)* 46(~D45)* 48(D2)* 49(D1)* 51(D0)* 54(D3)* 55(D36)* 57(~D37)* 58(~D44)*; U16 5(CTS#)* 6(TNOW)*; U19 7* 8*; U25 4(VOUT)*

## Notes on the sheets
sheet 1
- IMU is powered through a pin
  on the artemis. If this doesn't
  work, the backup terminals can
  be shorted.
- This is reversed on the PCB
- Make cuttable.
- Cut R from VCC_RF for passive antenna.
- Power GPS
- GPS
sheet 2
- JTAG / SWD debug & programmer
- Power ON indicator.
- AD13
- AD31
- AD32
- AD35
- D38
- UART1 (use pads in code)
- IOM3
